# EAGLE design mbc_84_24_01_06 (EAGLE 7.6.0)

## Sheet 1 of 2
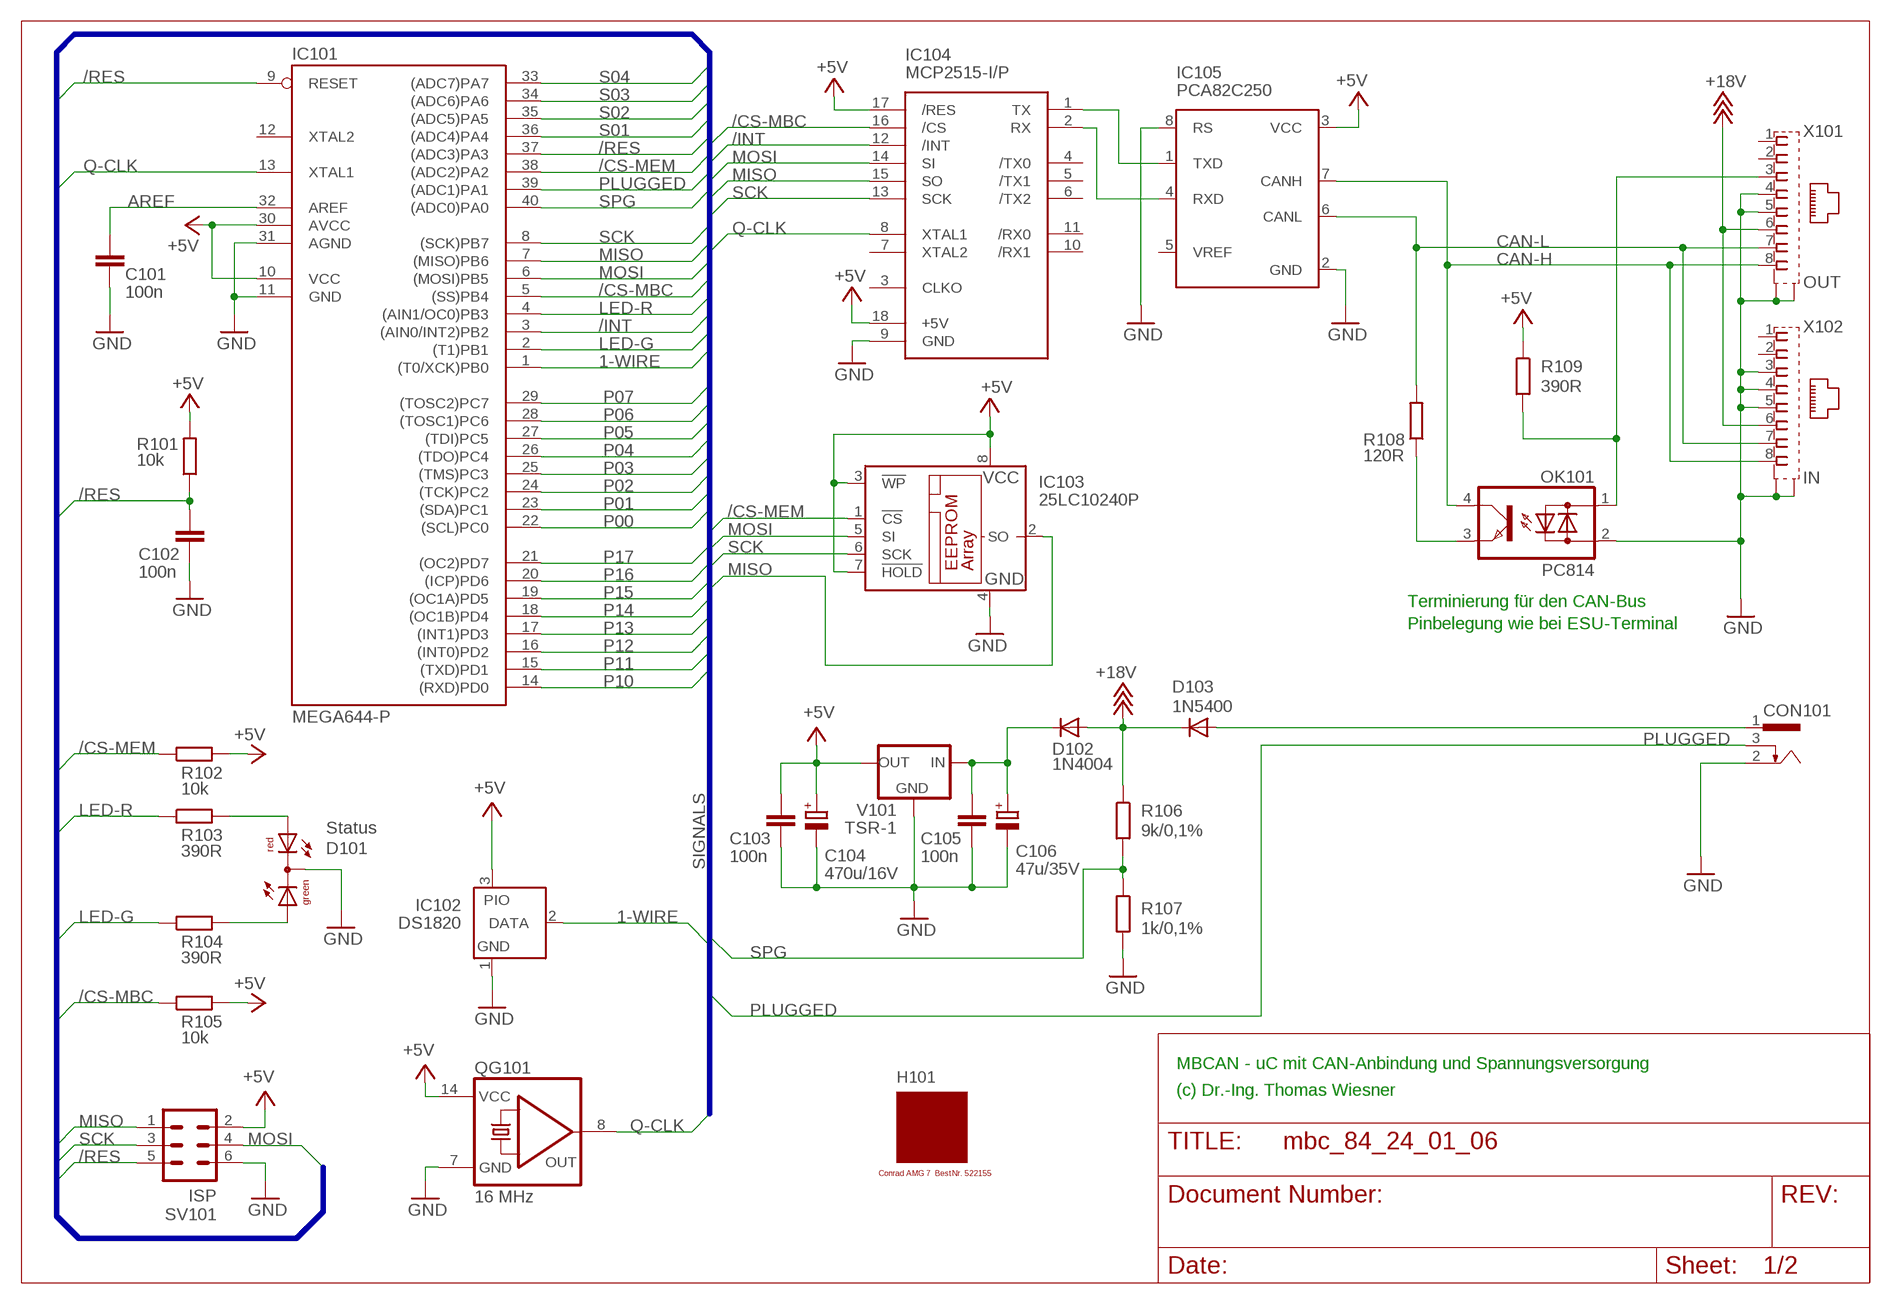
[diagram p0: schematic, sheet 1]

### Parts
C101  100n  C-EU025-025X050  [C025-025X050]
C102  100n  C-EU025-025X050  [C025-025X050]
C103  100n  C-EU025-025X050  [C025-025X050]
C104  470u/16V  CPOL-EUE3.5-8  [E3,5-8]
C105  100n  C-EU025-025X050  [C025-025X050]
C106  47u/35V  CPOL-EUE2.5-7  [E2,5-7]
CON101  POWER-JACK  [POWER-JACK]
D101  Status  DUOLED5MM  [DUOLED5MM]
D102  1N4004  [DO41-10]
D103  1N5400  [DO201-15]
H101  MODULGEHÄUSE-AMG-7  [MODULGEHÄUSE-1]
IC101  MEGA644-P  MEGA323-P  [DIL40]
IC102  DS1820  DS2405  [TO92-]
IC103  25LC10240P  25LC040P  [DIL8]
IC104  MCP2515-I/P  MCP2510-I/P  [DIL18]
IC105  PCA82C250  [DIL08]
OK101  PC814  [DIL04]
QG101  16 MHz  QG5860  [DIL14S]
R101  10k  R-EU_0207/10  [0207/10]
R102  10k  R-EU_0207/10  [0207/10]
R103  390R  R-EU_0207/10  [0207/10]
R104  390R  R-EU_0207/10  [0207/10]
R105  10k  R-EU_0207/10  [0207/10]
R106  9k/0,1%  R-EU_0207/10  [0207/10]
R107  1k/0,1%  R-EU_0207/10  [0207/10]
R108  120R  R-EU_0207/10  [0207/10]
R109  390R  R-EU_0207/10  [0207/10]
SV101  ISP  ML6  [ML6]
V101  TSR-1  [TRACO-TSR-1]
X101  OUT  0446200002  [0446200002]
X102  IN  0446200002  [0446200002]

### Nets
1-WIRE: IC101.1((T0/XCK)PB0) IC102.2(DATA)
+5V: C103.1 C104.+ IC101.10(VCC) IC101.30(AVCC) IC102.3(PIO) IC103.3(!WP) IC103.7(!HOLD) IC103.8(VCC) IC104.17(/RES) IC104.18(+5V) IC105.3(VCC) QG101.14(VCC) R101.2 R102.2 R105.2 R109.1 SV101.2 V101.OUT ; also sheet 2
+18V: D102.A D103.C R106.1 X101.6 X102.6 ; also sheet 2
/CS-MBC: IC101.5((SS)PB4) IC104.16(/CS) R105.1
/CS-MEM: IC101.38((ADC2)PA2) IC103.1(!CS) R102.1
/INT: IC101.3((AIN0/INT2)PB2) IC104.12(/INT)
/RES: C102.1 IC101.9(RESET) IC101.37((ADC3)PA3) R101.1 SV101.5
AREF: C101.1 IC101.32(AREF)
CAN-H: IC105.7(CANH) OK101.4(C) X101.8 X102.8
CAN-L: IC105.6(CANL) R108.2 X101.7 X102.7
GND: C101.2 C102.2 C103.2 C104.- C105.2 C106.- CON101.2 D101.K(C) IC101.11(GND) IC101.31(AGND) IC102.1(GND) IC103.4(GND) IC104.9(GND) IC105.2(GND) IC105.8(RS) OK101.2(AC2) QG101.7(GND) R107.2 SV101.6 V101.GND X101.4 X101.5 X101.S@1(S1) X101.S@2(S2) X102.3 X102.4 X102.5 X102.S@1(S1) X102.S@2(S2) ; also sheet 2
LED-G: IC101.2((T1)PB1) R104.1
LED-R: IC101.4((AIN1/OC0)PB3) R103.1
MISO: IC101.7((MISO)PB6) IC103.2(SO) IC104.15(SO) SV101.1
MOSI: IC101.6((MOSI)PB5) IC103.5(SI) IC104.14(SI) SV101.4
N$1: IC104.1(TX) IC105.1(TXD)
N$2: IC104.2(RX) IC105.4(RXD)
N$3: OK101.3(E) R108.1
N$5: OK101.1(AC1) R109.2 X101.3
N$6: C105.1 C106.+ D102.C V101.IN
N$9: D101.AR R103.2
N$13: D101.AG R104.2
P00: IC101.22((SCL)PC0) ; also sheet 2
P01: IC101.23((SDA)PC1) ; also sheet 2
P02: IC101.24((TCK)PC2) ; also sheet 2
P03: IC101.25((TMS)PC3) ; also sheet 2
P04: IC101.26((TDO)PC4) ; also sheet 2
P05: IC101.27((TDI)PC5) ; also sheet 2
P06: IC101.28((TOSC1)PC6) ; also sheet 2
P07: IC101.29((TOSC2)PC7) ; also sheet 2
P10: IC101.14((RXD)PD0) ; also sheet 2
P11: IC101.15((TXD)PD1) ; also sheet 2
P12: IC101.16((INT0)PD2) ; also sheet 2
P13: IC101.17((INT1)PD3) ; also sheet 2
P14: IC101.18((OC1B)PD4) ; also sheet 2
P15: IC101.19((OC1A)PD5) ; also sheet 2
P16: IC101.20((ICP)PD6) ; also sheet 2
P17: IC101.21((OC2)PD7) ; also sheet 2
PLUGGED: CON101.3 IC101.39((ADC1)PA1)
Q-CLK: IC101.13(XTAL1) IC104.8(XTAL1) QG101.8(OUT)
S01: IC101.36((ADC4)PA4) ; also sheet 2
S02: IC101.35((ADC5)PA5) ; also sheet 2
S03: IC101.34((ADC6)PA6) ; also sheet 2
S04: IC101.33((ADC7)PA7) ; also sheet 2
SCK: IC101.8((SCK)PB7) IC103.6(SCK) IC104.13(SCK) SV101.3
SPG: IC101.40((ADC0)PA0) R106.2 R107.1
V-NETZTEIL1: CON101.1 D103.A
Unconnected: IC101.12(XTAL2) IC104.3(CLKO) IC104.4(/TX0) IC104.5(/TX1) IC104.6(/TX2) IC104.7(XTAL2) IC104.10(/RX1) IC104.11(/RX0) IC105.5(VREF) X101.1 X101.2 X102.1 X102.2

### Buses
SIGNALS

### Notes on the sheet
- Terminierung für den CAN-Bus
- Pinbelegung wie bei ESU-Terminal
- MBCAN - uC mit CAN-Anbindung und Spannungsversorgung
- (c) Dr.-Ing. Thomas Wiesner

## Sheet 2 of 2
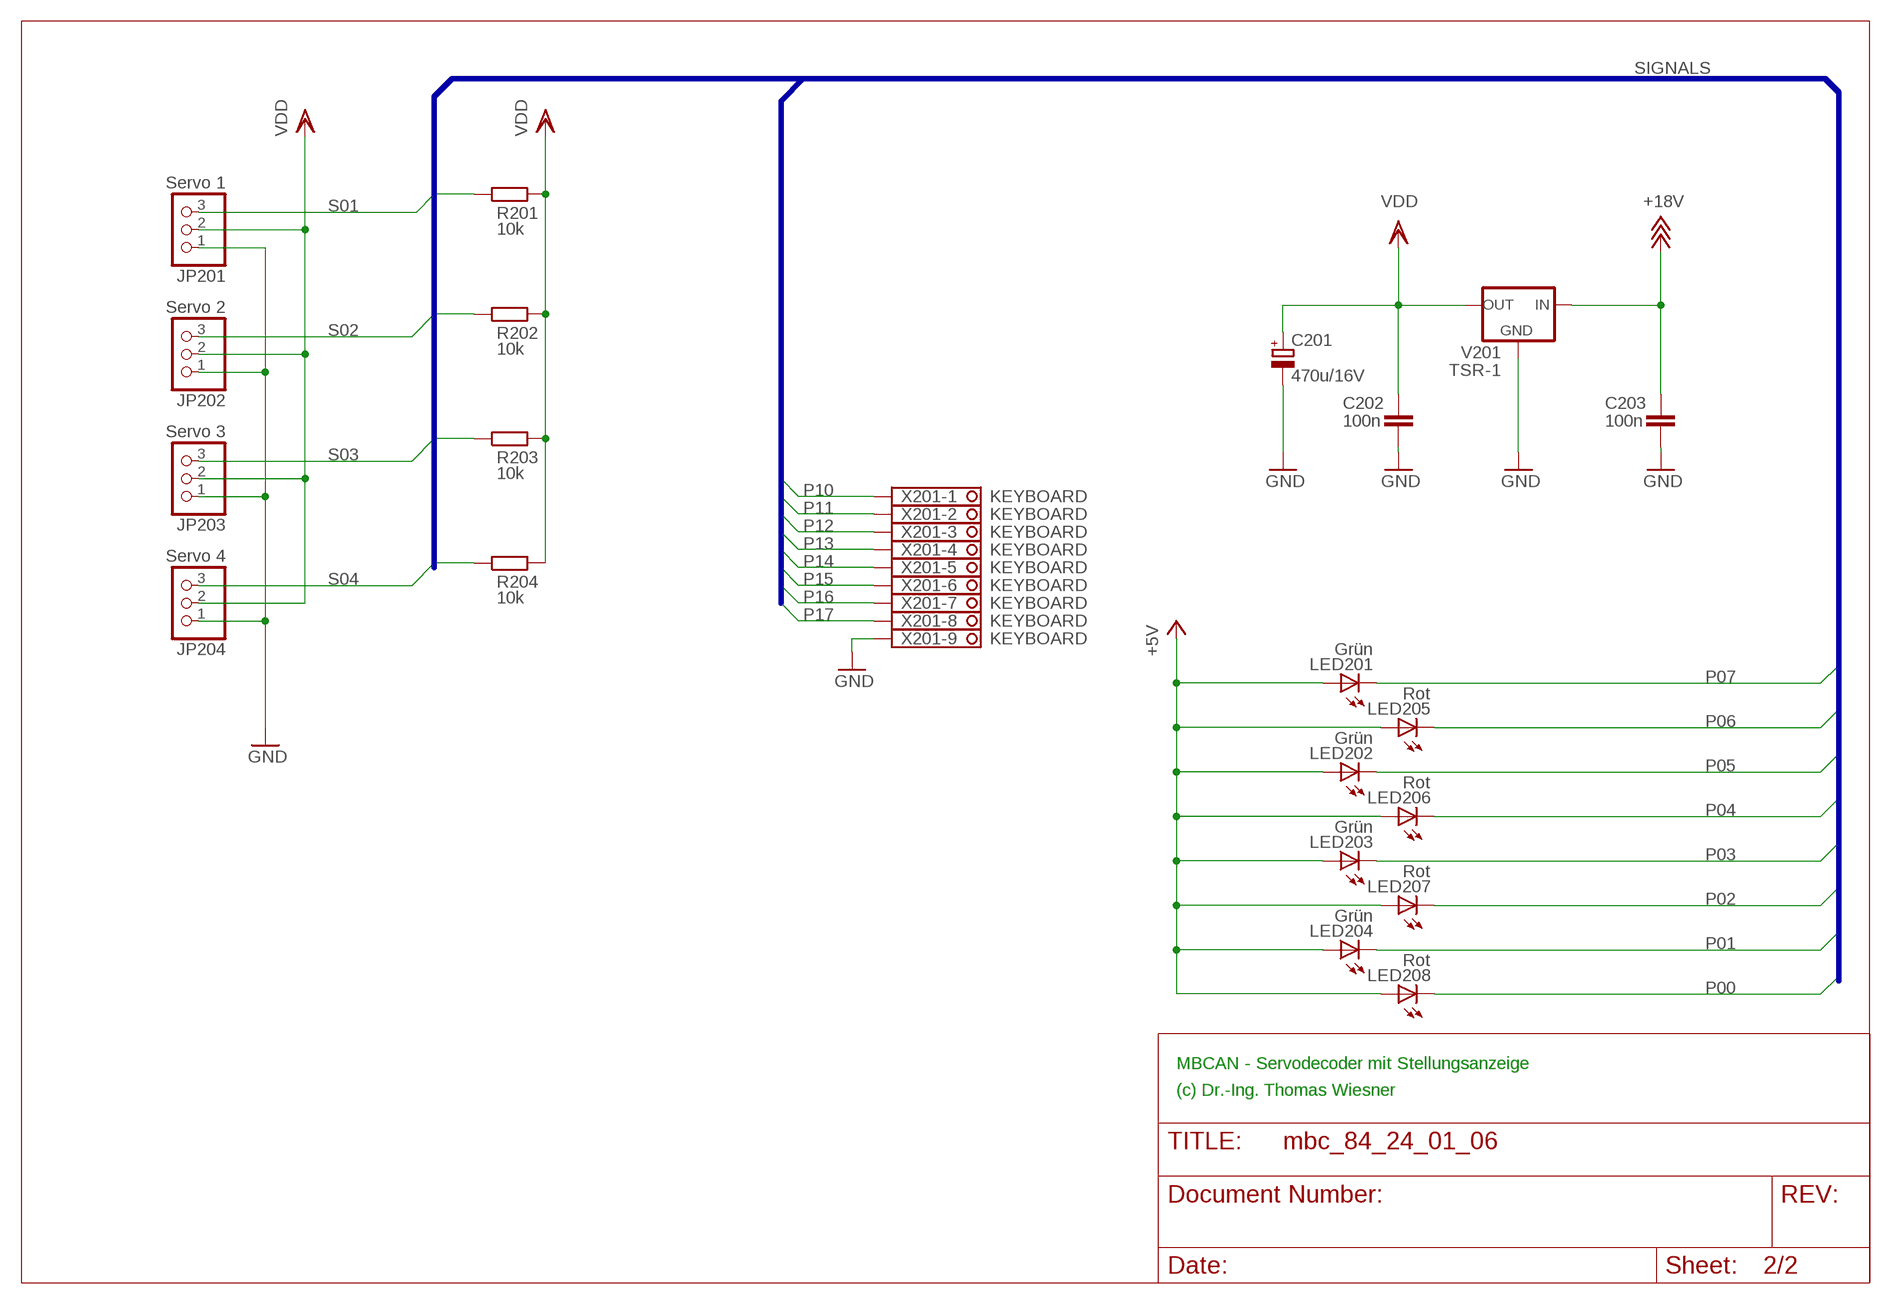
[diagram p1: schematic, sheet 2]

### Parts
C201  470u/16V  CPOL-EUE3.5-8  [E3,5-8]
C202  100n  C-EU025-025X050  [C025-025X050]
C203  100n  C-EU025-025X050  [C025-025X050]
JP201  Servo 1  PINHD-1X3  [1X03]
JP202  Servo 2  PINHD-1X3  [1X03]
JP203  Servo 3  PINHD-1X3  [1X03]
JP204  Servo 4  PINHD-1X3  [1X03]
LED201  Grün  LED3MM  [LED3MM]
LED202  Grün  LED3MM  [LED3MM]
LED203  Grün  LED3MM  [LED3MM]
LED204  Grün  LED3MM  [LED3MM]
LED205  Rot  LED3MM  [LED3MM]
LED206  Rot  LED3MM  [LED3MM]
LED207  Rot  LED3MM  [LED3MM]
LED208  Rot  LED3MM  [LED3MM]
R201  10k  R-EU_0207/10  [0207/10]
R202  10k  R-EU_0207/10  [0207/10]
R203  10k  R-EU_0207/10  [0207/10]
R204  10k  R-EU_0207/10  [0207/10]
V201  TSR-1  [TRACO-TSR-1]
X201  KEYBOARD  1751316  [1751316]

### Nets
+5V: LED201.A LED202.A LED203.A LED204.A LED205.A LED206.A LED207.A LED208.A ; also sheet 1
+18V: C203.1 V201.IN ; also sheet 1
GND: C201.- C202.2 C203.2 JP201.1 JP202.1 JP203.1 JP204.1 V201.GND X201.9 ; also sheet 1
P00: LED208.K(C) ; also sheet 1
P01: LED204.K(C) ; also sheet 1
P02: LED207.K(C) ; also sheet 1
P03: LED203.K(C) ; also sheet 1
P04: LED206.K(C) ; also sheet 1
P05: LED202.K(C) ; also sheet 1
P06: LED205.K(C) ; also sheet 1
P07: LED201.K(C) ; also sheet 1
P10: X201.1 ; also sheet 1
P11: X201.2 ; also sheet 1
P12: X201.3 ; also sheet 1
P13: X201.4 ; also sheet 1
P14: X201.5 ; also sheet 1
P15: X201.6 ; also sheet 1
P16: X201.7 ; also sheet 1
P17: X201.8 ; also sheet 1
S01: JP201.3 R201.1 ; also sheet 1
S02: JP202.3 R202.1 ; also sheet 1
S03: JP203.3 R203.1 ; also sheet 1
S04: JP204.3 R204.1 ; also sheet 1
VDD: C201.+ C202.1 JP201.2 JP202.2 JP203.2 JP204.2 R201.2 R202.2 R203.2 R204.2 V201.OUT

### Buses
SIGNALS

### Notes on the sheet
- MBCAN - Servodecoder mit Stellungsanzeige
- (c) Dr.-Ing. Thomas Wiesner

## Library data of the parts
C101-C103 C105 C202 C203 = rcl:C-EU: CAPACITOR, European symbol
C104 C106 C201 = rcl:CPOL-EU: POLARIZED CAPACITOR, European symbol
CON101 = mbc:POWER-JACK
D101 = led:DUOLED5MM: DUO LED 2 colors, 5 mm, round
D102 = diode:1N4004: DIODE general purpose rectifier, 1 A
D103 = diode:1N5400: DIODE standard rectifier, 3 A, 50 V (Motorola)
H101 = mbc:MODULGEHÄUSE-AMG-7: Gehäuse Conrad AMG 7 BestNr. 522155
IC101 = atmel:MEGA323-P: MICROCONTROLLER 32 Kbytes FLASH 2 Kbytes SRAM 1 Kbytes EEPROM USART 8-channel 10 bit ADC Source: avr.lbr; OC_FARNELL: unknown; OC_NEWARK: unknown
IC102 = maxim:DS2405: Addressable Switch DALLAS Semiconductor; MF: DALLAS SEMICONDUCTOR; MPN: DS2405; OC_FARNELL: 1188025; OC_NEWARK: 06F4645
IC103 = microchip:25*: Serial EEPROM 4K/ 8K , SPI bus; MF: MICROCHIP; MPN: 25LC040/P; OC_FARNELL: 9758100; OC_NEWARK: 96K4091
IC104 = mbc:MCP2510: BASIC-CAN 2.0a Controller Stand-alone CAN controller von Microchip
IC105 = micro-philips:PCA82C250: CAN CONTROLLER INTERFACE; OC_FARNELL: 3692358; OC_NEWARK: unknown
JP201-JP204 = pinhead:PINHD-1X3: PIN HEADER
LED201-LED208 = led:LED: LED OSRAM: - CHIPLED LG R971, LG N971, LY N971, LG Q971, LY Q971, LO R971, LY R971 LH N974, LH R974 LS Q976, LO Q976, LY Q976 LO Q996 - Hyper CHIPLED LW Q18S LB Q993, LB Q99A, LB R99A - SideLED LS A670, LO A670, LY A670, LG A670, LP A670 LB A673, LV A673, LT A673, LW A673 LH A674 LY A675 LS A676, LA A676, LO A676, LY A676, LW A676 LS A679, LY A679, LG A679 - Hyper Micro SIDELED® LS Y876, LA Y876, LO Y876, LY Y876 LT Y87S - SmartLED LW L88C, LW L88S LB L89C, LB L89S, LG L890 LS L89K, LO L89K, LY L89K LS L896, LA L896, LO L896, LY L896 - TOPLED LS T670, LO T670, LY T670, LG T670, LP T670 LSG T670, LSP T670, LSY T670, LOP T670, LYG T670 LG T671, LOG T671, LSG T671 LB T673, LV T673, LT T673, LW T673 LH T674 LS T676, LA T676, LO T676, LY T676, LB T676, LH T676, LSB T676, LW T676 LB T67C, LV T67C, LT T67C, LS T67K, LO T67K, LY T67K, LW E67C LS E67B, LA E67B, LO E67B, LY E67B, LB E67C, LV E67C, LT E67C LW T67C LS T679, LY T679, LG T679 LS T770, LO T770, LY T770, LG T770, LP T770 LB T773, LV T773, LT T773, LW T773 LH T774 LS E675, LA E675, LY E675, LS T675 LS T776, LA T776, LO T776, LY T776, LB T776 LHGB T686 LT T68C, LB T68C - Hyper Mini TOPLED® LB M676 - Mini TOPLED Santana® LG M470 LS M47K, LO M47K, LY M47K Source: http://www.osram.convergy.de LUXEON: - LUMILED® LXK2-PW12-R00, LXK2-PW12-S00, LXK2-PW14-U00, LXK2-PW14-V00 LXK2-PM12-R00, LXK2-PM12-S00, LXK2-PM14-U00 LXK2-PE12-Q00, LXK2-PE12-R00, LXK2-PE12-S00, LXK2-PE14-T00, LXK2-PE14-U00 LXK2-PB12-K00, LXK2-PB12-L00, LXK2-PB12-M00, LXK2-PB14-N00, LXK2-PB14-P00, LXK2-PB14-Q00 LXK2-PR12-L00, LXK2-PR12-M00, LXK2-PR14-Q00, LXK2-PR14-R00 LXK2-PD12-Q00, LXK2-PD12-R00, LXK2-PD12-S00 LXK2-PH12-R00, LXK2-PH12-S00 LXK2-PL12-P00, LXK2-PL12-Q00, LXK2-PL12-R00 Source: www.luxeon.com KINGBRIGHT: KA-3528ASYC Source: www.kingbright.com
OK101 = optocoupler:PC814: SHARP OPTO COUPLER; OC_FARNELL: 9707662; OC_NEWARK: unknown
QG101 = crystal:QG5860: CRYSTAL RESONATOR; OC_FARNELL: unknown; OC_NEWARK: unknown
R101-R109 R201-R204 = resistor:R-EU_: RESISTOR, European symbol
SV101 = con-ml:ML6: HARTING; OC_FARNELL: unknown; OC_NEWARK: unknown
V101 V201 = mbc:TSR-1: Spannungsregler Hersteller: TRACO Typ: TSR-1 5V: TSR 1-2450 Spg: 5V Strom: 1A Reichelt TSR 1-2450
X101 X102 = mbc:0446200002: RJ-45 INVERTED MODULAR JACK ASSEMBLY WITH RJ-11 KEEPOUT FEATURE Source: Data sheet <http://www.farnell.com/datasheets/73207.pdf> MOLEX 0446200002 BUCHSE, RJ45, GESCHIRMT Source: Farnell <http://de.farnell.com/molex/0446200002/buchse-rj45-geschirmt/dp/9251910?ost=9251910>; MF: MOLEX; MPN: 0446200002; OC_FARNELL: 9251910
X201 = con-phoenix-350:1751316: MKDS 1/ 9-3,5 Printklemme Nennstrom: 10 A Bemessungsspannung: 160 V Raster: 3,5 mm Polzahl: 9 Montageart: Löten Anschlussart: Schraubanschluss Anschlussrichtung vom Leiter zur Platine: 0° Source: http://eshop.phoenixcontact.com .. 1751316.pdf; OC_FARNELL: unknown; OC_NEWARK: unknown

## Board
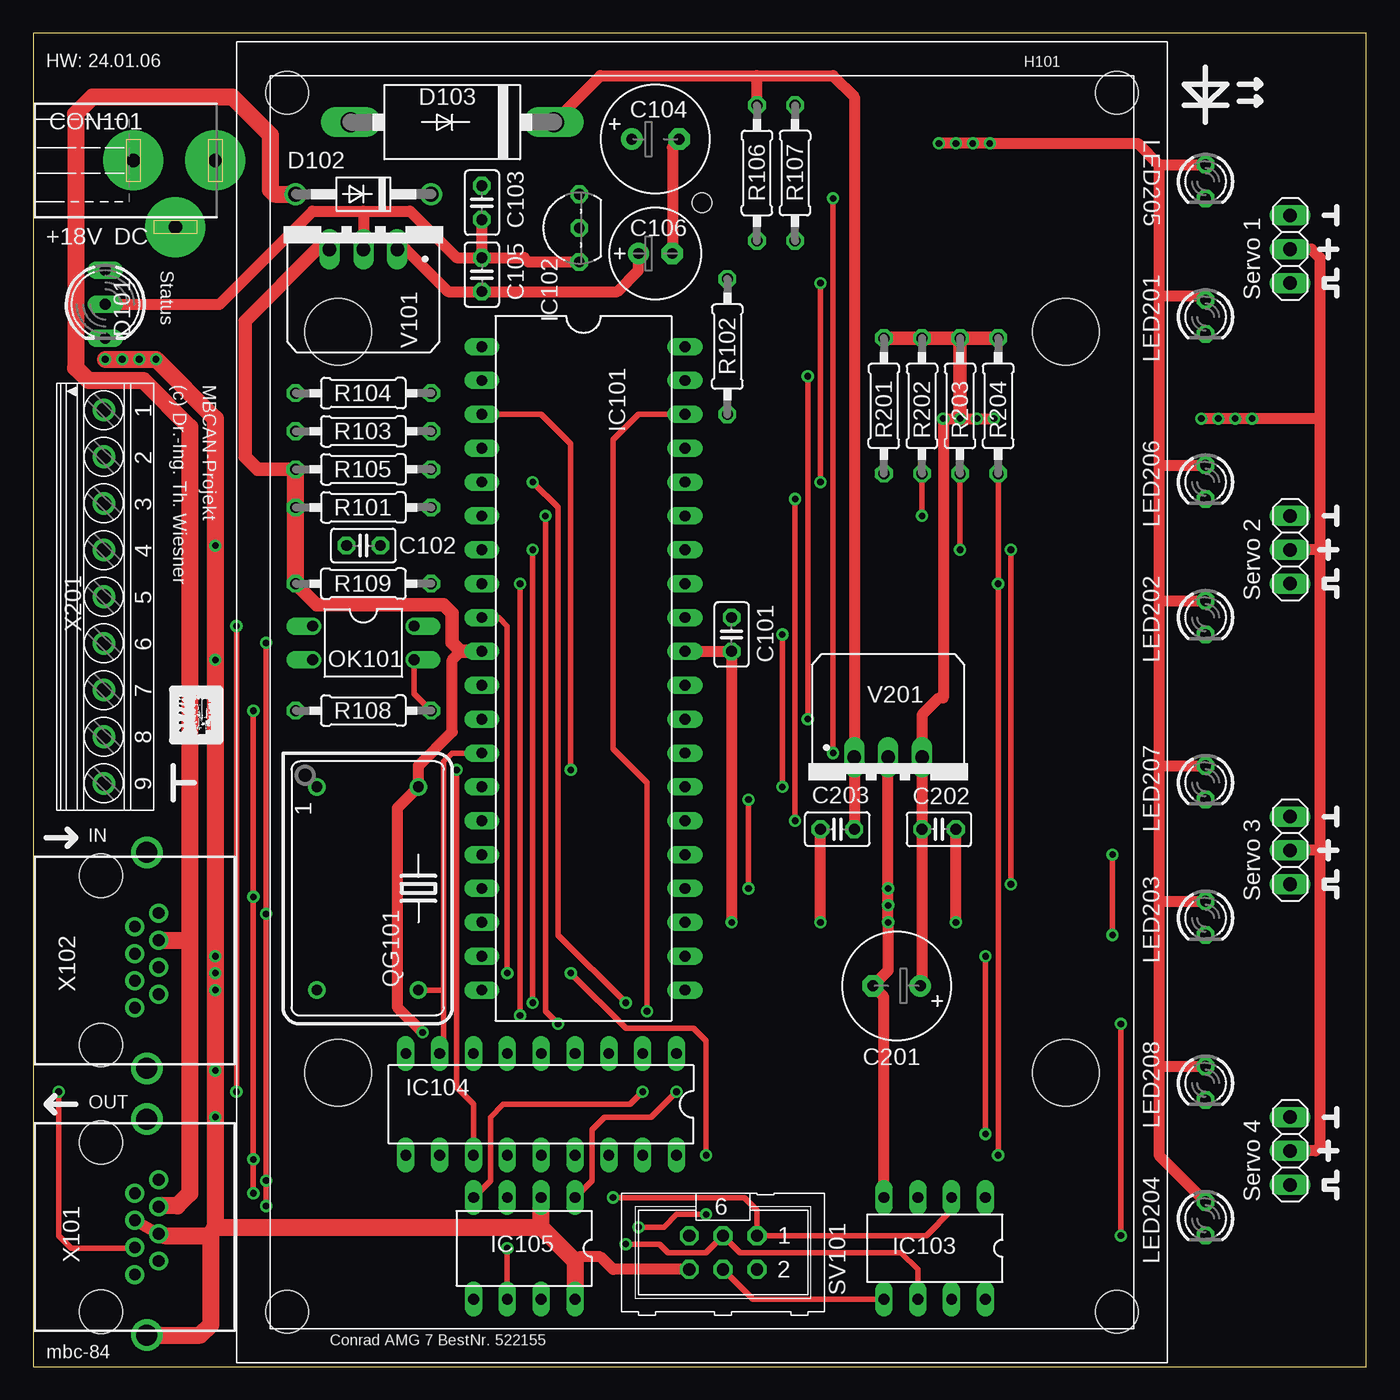
[diagram p2: board, top side]
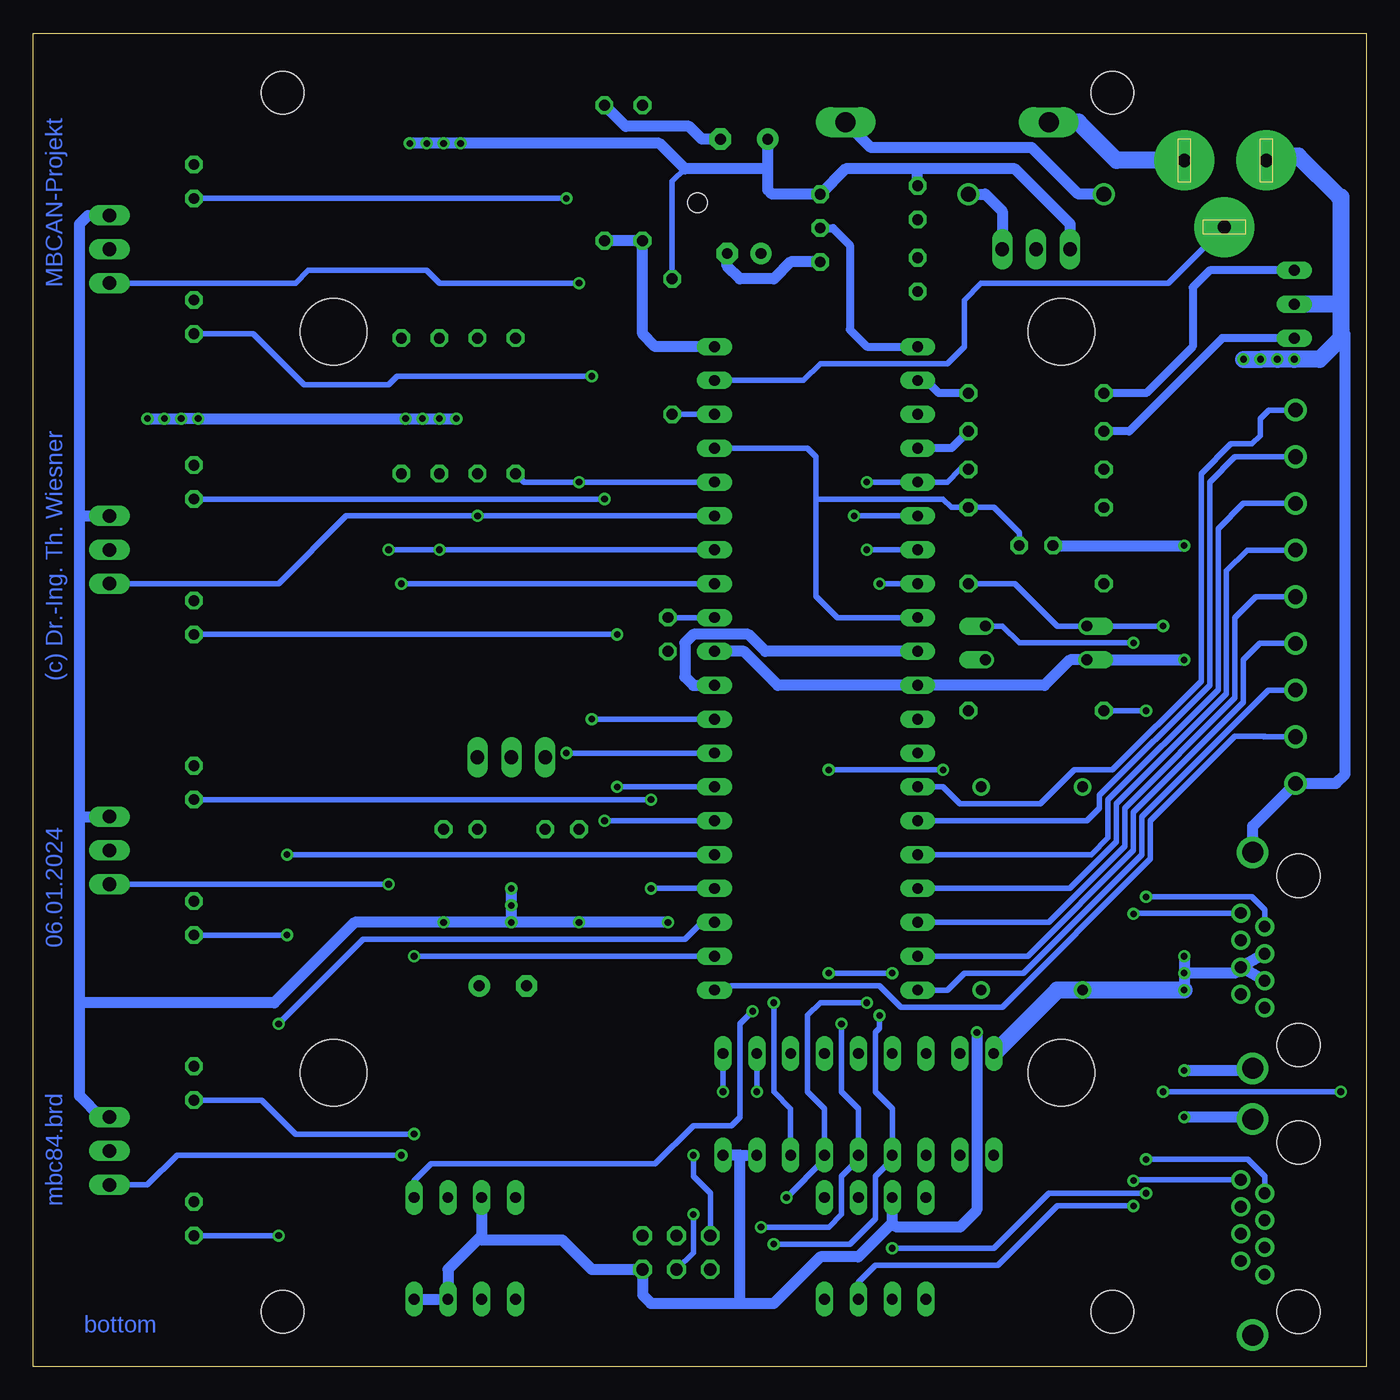
[diagram p3: board, bottom side, seen from below]

Size 100 x 99.99 mm. Coordinates in mm from the lower left corner, seen from the top.
Outline: 0,99.99 0,0 100,0 100,99.99 0,99.99
Copper layers (1*16): Top 0.035mm / dielectric 1.5mm / Bottom 0.035mm
Design rules "default *": minimum track width 10mil, minimum drill 0.5mm, track to track 8mil, track to pad 8mil, pad to pad 8mil, via to via 8mil, smd to smd 8mil, copper to edge 40mil, drill to drill 8mil, minimum pad ring 10mil, minimum via ring 8mil, stop-mask expansion 4mil, vias tented up to drill 0mil, thermal gap 10mil

### Footprints (pad centres in the part's own frame; a part is rotated, then mirrored left to right if it is on the bottom)
C025-025X050 = drill 0.813 octagon: 1 -1.27,0; 2 1.27,0
E3,5-8 = drill 0.813 pad 1.6: + -1.778,0 | drill 0.813 pad 1.6 octagon: - 1.778,0
E2,5-7 = drill 0.813 pad 1.6: + -1.27,0 | drill 0.813 pad 1.6 octagon: - 1.27,0
POWER-JACK = drill 1 pad 4.5: 1 0,6.03; 2 0,-0.12; 3 5,3.03
DUOLED5MM = drill 0.813 long: AG -2.54,0; AR 2.54,0; K 0,0
DO41-10 = drill 1.118: A 5.08,0; C -5.08,0
DO201-15 = drill 1.499 long: A 7.62,0; C -7.62,0
MODULGEHÄUSE-1 = hole 3.2: -45.72,-31.115; -45.72,31.115; 45.72,31.115; 45.72,-31.115 | hole 5: -27.781,-27.305; 27.781,-27.305; -27.781,27.305; 27.781,27.305 | hole 1.5: -37.465,0
DIL40 = drill 0.813 long: 1 -24.13,-7.62; 2 -21.59,-7.62; 3 -19.05,-7.62; 4 -16.51,-7.62; 5 -13.97,-7.62; 6 -11.43,-7.62; 7 -8.89,-7.62; 8 -6.35,-7.62; 9 -3.81,-7.62; 10 -1.27,-7.62; 11 1.27,-7.62; 12 3.81,-7.62; 13 6.35,-7.62; 14 8.89,-7.62; 15 11.43,-7.62; 16 13.97,-7.62; 17 16.51,-7.62; 18 19.05,-7.62; 19 21.59,-7.62; 20 24.13,-7.62; 21 24.13,7.62; 22 21.59,7.62; 23 19.05,7.62; 24 16.51,7.62; 25 13.97,7.62; 26 11.43,7.62; 27 8.89,7.62; 28 6.35,7.62; 29 3.81,7.62; 30 1.27,7.62; 31 -1.27,7.62; 32 -3.81,7.62; 33 -6.35,7.62; 34 -8.89,7.62; 35 -11.43,7.62; 36 -13.97,7.62; 37 -16.51,7.62; 38 -19.05,7.62; 39 -21.59,7.62; 40 -24.13,7.62
TO92- = drill 0.813 octagon: 1 -2.54,0; 2 0,0; 3 2.54,0
DIL8 = drill 0.813 long: 1 -3.81,-3.81; 2 -1.27,-3.81; 3 1.27,-3.81; 4 3.81,-3.81; 5 3.81,3.81; 6 1.27,3.81; 7 -1.27,3.81; 8 -3.81,3.81
DIL18 = drill 0.813 long: 1 -10.16,-3.81; 2 -7.62,-3.81; 3 -5.08,-3.81; 4 -2.54,-3.81 | drill 0.8 long: 5 0,-3.81; 6 2.54,-3.81; 7 5.08,-3.81; 8 7.62,-3.81; 9 10.16,-3.81; 10 10.16,3.81; 11 7.62,3.81; 12 5.08,3.81; 13 2.54,3.81; 14 0,3.81; 15 -2.54,3.81; 16 -5.08,3.81; 17 -7.62,3.81; 18 -10.16,3.81
DIL08 = drill 0.813 long: 1 -3.81,-3.81; 2 -1.27,-3.81; 3 1.27,-3.81; 4 3.81,-3.81; 5 3.81,3.81; 6 1.27,3.81; 7 -1.27,3.81; 8 -3.81,3.81
1X03 = drill 1.016 long: 1 -2.54,0; 2 0,0; 3 2.54,0
LED3MM = drill 0.813 octagon: A -1.27,0; K 1.27,0
DIL04 = drill 0.813 offset: 1 -1.27,-3.81; 2 1.27,-3.81; 3 1.27,3.81; 4 -1.27,3.81
DIL14S = drill 0.813: 1 -7.62,-3.81; 7 7.62,-3.81; 8 7.62,3.81; 14 -7.62,3.81
0207/10 = drill 0.813 octagon: 1 -5.08,0; 2 5.08,0
ML6 = drill 0.914 octagon: 1 -2.54,-1.27; 2 -2.54,1.27; 3 0,-1.27; 4 0,1.27; 5 2.54,-1.27; 6 2.54,1.27
TRACO-TSR-1 = drill 1.016 long: GND 0,2.54; IN -2.54,2.54; OUT 2.54,2.54
0446200002 = drill 0.889 pad 1.422: 1 3.556,2.54; 2 2.54,4.318; 3 1.524,2.54; 4 0.508,4.318; 5 -0.508,2.54; 6 -1.524,4.318; 7 -2.54,2.54; 8 -3.556,4.318 | drill 1.575 pad 2.286: S@1 -8.103,3.429; S@2 8.103,3.429 | hole 3.251: 6.35,0; -6.35,0
1751316 = drill 1.1 pad 1.7: 1 -13.973,-0.1; 2 -10.473,-0.1; 3 -6.973,-0.1; 4 -3.473,-0.1; 5 0.028,-0.1; 6 3.527,-0.1; 7 7.027,-0.1; 8 10.527,-0.1; 9 14.027,-0.1

### Placement (x,y rotation side)
C101  52.39,54.91 270 top
C102  24.77,61.57 180 top
C103  33.66,87.29 270 top
C104  46.67,92.06 0 top
C105  33.66,81.9 90 top
C106  46.67,83.48 0 top
C201  64.77,28.55 180 top
C202  67.94,40.3 0 top
C203  60.33,40.3 180 top
CON101  7.62,90.47 270 top
D101  5.4,79.67 270 top
D102  24.77,87.93 180 top
D103  31.43,93.33 180 top
H101  50.16,49.83 270 top
IC101  41.27,52.37 270 top
IC102  40.96,85.39 90 top
IC103  67.63,8.87 180 top
IC104  38.1,19.66 180 top
IC105  36.83,8.87 180 top
JP201  94.3,83.8 270 top
JP202  94.3,61.26 270 top
JP203  94.3,38.71 270 top
JP204  94.3,16.17 270 top
LED201  87.95,78.72 270 top
LED202  87.95,56.18 270 top
LED203  87.95,33.63 270 top
LED204  87.95,11.09 270 top
LED205  87.95,88.88 270 top
LED206  87.95,66.34 270 top
LED207  87.95,43.79 270 top
LED208  87.95,21.25 270 top
OK101  24.77,54.27 270 top
QG101  25.08,35.86 270 top
R101  24.77,64.43 180 top
R102  52.07,76.5 90 top
R103  24.77,70.15 180 top
R104  24.77,73.01 180 top
R105  24.77,67.29 180 top
R106  54.29,89.52 270 top
R107  57.15,89.52 90 top
R108  24.77,49.19 180 top
R109  24.77,58.72 0 top
R201  63.82,72.05 90 top
R202  66.67,72.05 90 top
R203  69.53,72.05 90 top
R204  72.39,72.05 90 top
SV101  51.75,8.55 180 top
V101  24.77,86.34 180 top
V201  64.14,43.16 0 top
X101  5.08,10.46 270 top
X102  5.08,30.46 270 top
X201  5.4,57.76 270 top

### Tracks (layer width: path | path; a pad name or v marks a point on that pad's centre or on a via)
1-WIRE
  Bottom 0.61: IC102.2 40.01,85.39 38.73,84.12 38.73,77.77 37.47,76.5 IC101.1
+5V  (via drill 0.5)
  Top 0.813: v29.21,25.06 27.3,26.97 27.3,41.89 QG101.14 28.89,45.06 31.43,47.6 31.43,53 32.07,53.64 | LED204.A 84.45,15.86 84.45,22.52 | 84.45,22.52 LED208.A | 84.45,57.45 84.45,45.06 | 84.45,45.06 84.45,34.9 | 84.45,34.9 84.45,22.52 | 84.45,34.9 LED203.A | 84.45,45.06 LED207.A | 84.45,57.45 LED202.A | 84.45,90.15 84.45,80.31 | 84.45,80.31 84.45,67.61 | 84.45,67.61 84.45,57.45 | 84.45,90.15 LED205.A | 84.45,67.61 LED206.A | LED201.A 87.63,80.31 84.45,80.31 | 84.45,90.15 82.87,91.74 v71.75,91.74 v70.48,91.74 v69.22,91.74 v67.94,91.74
  Top 1.016: IC101.10 32.07,53.64 31.43,54.27 31.43,56.49 30.8,57.13 21.27,57.13 R109.1 | V101.OUT 21.27,83.8 15.88,78.4 15.88,68.24 16.83,67.29 R105.2
  Top 1.27: R109.1 R101.2 R105.2
  Bottom 0.406: C104.+ 44.9,89.83 | R102.2 52.07,88.88 51.12,89.83
  Bottom 0.813: 46.99,15.86 IC104.18 | 46.99,15.86 IC104.17 | 46.99,4.74 46.99,15.86 | IC101.10 45.09,53.64 46.35,54.91 50.48,54.91 51.12,54.27 51.12,51.73 50.48,51.1 IC101.30 | 33.66,89.83 26.35,89.83 22.23,85.7 V101.OUT | 33.66,89.83 39.05,89.83 IC102.3 44.58,87.93 44.9,88.25 C104.+ | 44.9,89.83 51.12,89.83 53.02,91.74 v67.94,91.74 v69.22,91.74 v70.48,91.74 v71.75,91.74 | 35.56,10.78 38.1,8.24 40.96,8.24 44.45,4.74 46.99,4.74 | 35.56,10.78 IC105.3 | v29.21,25.06 29.21,11.73 30.48,10.46 35.24,10.46 35.56,10.78 | 46.99,4.74 53.66,4.74 54.29,5.38 SV101.2 58.1,7.28 60.33,9.51 66.36,9.51 IC103.3 66.36,9.82 68.9,7.28 IC103.7 IC103.8 | C103.1 33.66,89.83
+18V
  Top 0.813: D103.C 42.55,96.82 54.29,96.82 | 54.29,96.82 60.01,96.82 61.59,95.23 V201.IN C203.1 | R106.1 54.29,96.82
  Top 1.27: 11.75,32.05 11.75,70.47 8.26,73.96 4.13,73.96 3.17,74.91 3.17,93.96 4.45,95.23 14.92,95.23 17.78,92.37 17.78,88.25 18.1,87.93 D102.A | 11.75,32.05 11.75,13 10.79,12.04 9.46,12.04 X101.6 | X102.6 11.68,31.98 11.75,32.05
  Bottom 0.813: D102.A 21.59,87.93 25.08,91.42 37.15,91.42 D103.C
/CS-MBC  (via drill 0.5)
  Top 0.406: v37.47,66.34 39.37,64.43 39.37,32.36 v44.45,27.29
  Bottom 0.406: v37.47,66.34 IC101.5 31.43,66.34 30.48,67.29 R105.1 | v44.45,27.29 44.45,20.62 43.18,19.35 IC104.16
/CS-MEM  (via drill 0.5)
  Top 0.406: v46.04,26.65 46.04,43.79 43.5,46.33 43.5,69.51 45.4,71.42 IC101.38
  Bottom 0.406: R102.1 IC101.38 | IC103.1 71.44,13.95 70.17,15.22 53.34,15.22 50.48,18.08 47.62,18.08 46.99,18.71 46.99,25.7 v46.04,26.65
/INT  (via drill 0.5)
  Top 0.406: IC104.12 33.02,19.66 31.75,20.93 v31.75,44.75 | v40.32,44.75 40.32,69.2 38.1,71.42 IC101.3
  Bottom 0.406: v31.75,44.75 v40.32,44.75
/RES  (via drill 0.5)
  Top 0.406: v35.56,29.51 35.56,55.54 34.92,56.18 IC101.9 | v40.32,29.51 44.45,25.38 49.53,25.38 50.48,24.43 v50.48,15.86
  Bottom 0.406: IC101.37 41.91,68.88 41.27,68.24 41.27,65.07 | 41.27,65.07 41.27,57.76 39.69,56.18 IC101.9 | v35.56,29.51 v40.32,29.51 | v50.48,15.86 50.48,14.27 49.21,13 SV101.5 | 41.27,65.07 31.75,65.07 31.11,64.43 R101.1 27.94,64.43 26.04,62.53 C102.1
AREF
  Bottom 0.406: IC101.32 C101.1
CAN-H  (via drill 0.5)
  Top 0.406: v17.46,54.27 v17.46,33.95 v17.46,13.95 v17.46,12.04
  Bottom 0.406: X101.8 17.4,14.01 v17.46,13.95 | v17.46,54.27 26.04,54.27 27.3,55.54 OK101.4 | v17.46,12.04 23.18,12.04 27.62,7.6 36.83,7.6 38.1,6.33 IC105.7 | X102.8 17.4,34.02 v17.46,33.95
CAN-L  (via drill 0.5)
  Top 0.406: v16.51,49.19 v16.51,35.22 v16.51,15.54 v16.51,13 | v35.56,8.87 IC105.6
  Bottom 0.406: R108.2 v16.51,49.19 | v16.51,13 23.81,13 27.94,8.87 v35.56,8.87 | X101.7 7.62,14.27 8.89,15.54 v16.51,15.54 | X102.7 7.62,34.27 8.57,35.22 v16.51,35.22
GND  (via drill 0.5)
  Top 0.406: C104.- 48.45,91.93
  Top 0.813: 24.77,86.66 V101.GND | 24.77,86.66 28.26,86.66 31.75,83.17 C105.2 | C105.2 36.83,83.17 37.15,82.85 IC102.1 | D101.K 13.97,79.67 20.95,86.66 24.77,86.66 | 48.45,91.93 47.94,91.42 C106.- | IC101.31 C101.2 v52.39,33.32 | v59.05,33.32 C203.2 | v69.22,33.32 C202.2 | V201.GND v64.14,35.86 v64.14,34.59 v64.14,33.32 64.14,29.7 C201.- 63.82,27.73 IC103.4 | SV101.6 43.5,7.28 42.55,8.24 40.96,8.24 40.64,7.92 | X101.5 X101.4 | C105.2 C103.2
  Top 1.27: 13.65,10.46 v13.65,18.71 v13.65,22.21 v13.65,28.24 v13.65,29.51 v13.65,30.78 v13.65,53 v13.65,61.57 13.65,71.1 v9.21,75.55 v5.4,75.55 | 13.65,10.46 13.18,9.66 13.34,9.82 | IC105.8 40.64,7.92 38.1,10.46 | 38.1,10.46 IC105.2 | 13.65,10.46 38.1,10.46 | X101.S@2 12.54,2.35 13.34,3.15 13.34,9.82 | X101.4 9.84,9.82 13.34,9.82
  Bottom 0.61: 1.59,77.45 1.91,77.77
  Bottom 0.813: IC101.31 46.67,53.64 44.13,51.1 IC101.11 24.13,51.1 22.23,53 OK101.2 v13.65,53 | v52.39,33.32 v59.05,33.32 v64.14,33.32 | 96.52,27.29 81.92,27.29 75.88,33.32 v69.22,33.32 v64.14,33.32 | JP204.1 94.93,18.71 96.52,20.3 96.52,27.29 | 96.52,27.29 96.52,41.25 | 96.52,41.25 JP203.1 | 96.52,41.25 96.52,63.8 | 96.52,63.8 JP202.1 | 96.52,63.8 96.52,85.7 95.89,86.34 JP201.1 | v64.14,33.32 v64.14,34.59 v64.14,35.86 | 1.59,77.45 1.59,44.43 2.28,43.74 X201.9 8.51,40.53 X102.S@1 | C102.2 v13.65,61.57 | X101.S@1 8.66,18.71 v13.65,18.71 | X102.S@2 8.66,22.21 v13.65,22.21 | X102.5 X102.4 | X102.3 X102.4 | X102.4 9.84,29.51 v13.65,29.51 | v13.65,30.78 v13.65,28.24 | C104.- 49.85,92.06 50.8,93.01 55.56,93.01 R107.2 | IC102.1 43.18,82.85 44.45,81.58 46.99,81.58 47.94,82.53 C106.-
  Bottom 1.27: 1.91,79.67 1.91,87.73 2.02,87.73 5.08,90.79 7.18,90.79 CON101.2 | 1.91,79.67 D101.K | 1.91,79.67 1.91,77.77 1.91,77.13 3.49,75.55 v5.4,75.55 v6.67,75.55 v7.94,75.55 v9.21,75.55 | v13.65,28.24 QG101.7 23.18,28.24 IC104.9
LED-G
  Bottom 0.61: R104.1 32.07,73.01 33.02,73.96 IC101.2
LED-R
  Bottom 0.61: IC101.4 31.11,68.88 R103.1
MISO  (via drill 0.5)
  Top 0.406: v37.47,61.26 v37.47,27.29 | IC103.2 68.9,11.73 66.99,9.82 SV101.1 54.29,11.73 53.34,12.68 v43.5,12.68
  Bottom 0.406: IC101.7 v37.47,61.26 | v37.47,27.29 40.96,27.29 41.91,26.33 41.91,20.62 40.64,19.35 IC104.15 40.64,15.54 v43.5,12.68
MOSI  (via drill 0.5)
  Top 0.406: v38.42,63.8 38.42,26.65 v39.37,25.7 | IC103.5 53.98,5.06 SV101.4 | v45.4,10.46 47.31,10.46 48.26,11.41 v50.48,11.41
  Bottom 0.406: IC101.6 v38.42,63.8 | v39.37,25.7 39.37,20.62 38.1,19.35 IC104.14 38.1,15.54 39.37,14.27 39.37,11.41 40.32,10.46 v45.4,10.46 | v50.48,11.41 50.48,8.55 SV101.4
N$1  (via drill 0.5)
  Top 0.406: v48.26,20.62 46.35,18.71 42.86,18.71 41.91,17.76 41.91,13.95 IC105.1
  Bottom 0.406: v48.26,20.62 IC104.1
N$2  (via drill 0.5)
  Top 0.406: v45.72,20.62 44.77,19.66 35.24,19.66 34.29,18.71 34.29,13.95 IC105.4
  Bottom 0.406: v45.72,20.62 IC104.2
N$3
  Top 0.406: OK101.3 28.57,50.46 R108.1
N$5  (via drill 0.5)
  Top 0.406: v15.24,55.54 v15.24,20.62 | v1.91,20.62 1.91,9.82 2.86,8.87 7.56,8.87 X101.3
  Bottom 0.406: R109.2 26.35,58.72 23.18,55.54 OK101.1 v15.24,55.54 | v15.24,20.62 v1.91,20.62
N$6
  Top 0.813: V101.IN 27.94,83.8 31.11,80.62 C105.1 43.81,80.62 45.4,82.21 C106.+
  Bottom 0.813: V101.IN 27.3,86.66 28.57,87.93 D102.C
N$9
  Bottom 0.61: R103.2 17.78,70.15 10.79,77.13 D101.AR
N$13
  Bottom 0.61: R104.2 16.51,73.01 13.02,76.5 13.02,80.94 11.75,82.21 D101.AG
P00  (via drill 0.5)
  Top 0.406: v71.44,17.44 v71.44,30.78
  Bottom 0.406: LED208.K 82.87,19.98 80.33,17.44 v71.44,17.44 | v71.44,30.78 IC101.22
P01  (via drill 0.5)
  Top 0.406: v81.6,25.7 v81.6,9.82
  Bottom 0.406: IC101.23 49.85,33.32 51.12,32.05 75.25,32.05 v81.6,25.7 | v81.6,9.82 LED204.K
P02  (via drill 0.5)
  Top 0.406: v53.66,42.52 v53.66,35.86
  Bottom 0.406: LED207.K v53.66,42.52 | v53.66,35.86 IC101.24
P03  (via drill 0.5)
  Top 0.406: v80.96,38.4 v80.96,32.36
  Bottom 0.406: IC101.25 v80.96,38.4 | v80.96,32.36 LED203.K
P04  (via drill 0.5)
  Top 0.406: v57.15,65.07 v57.15,40.94
  Bottom 0.406: LED206.K v57.15,65.07 | v57.15,40.94 IC101.26
P05  (via drill 0.5)
  Top 0.406: v56.2,54.91 v56.2,43.48
  Bottom 0.406: LED202.K v56.2,54.91 | v56.2,43.48 IC101.27
P06  (via drill 0.5)
  Top 0.406: v60.01,87.61 v60.01,46.02
  Bottom 0.406: LED205.K v60.01,87.61 | v60.01,46.02 IC101.28
P07  (via drill 0.5)
  Top 0.406: v58.1,74.28 v58.1,48.56
  Bottom 0.406: LED201.K 83.5,77.45 79.69,73.64 73.34,73.64 72.71,74.28 v58.1,74.28 | v58.1,48.56 IC101.29
P10
  Bottom 0.406: X201.1 7.3,71.74 7.94,71.1 7.94,69.83 8.57,69.2 10.16,69.2 12.38,66.97 12.38,51.41 19.05,44.75 21.91,44.75 24.45,42.21 30.48,42.21 31.75,43.48 IC101.14
P11
  Bottom 0.406: X201.2 9.85,68.24 11.75,66.34 11.75,51.1 20,42.84 20,41.89 20.95,40.94 IC101.15
P12
  Bottom 0.406: X201.3 9.22,64.74 11.11,62.84 11.11,50.78 19.37,42.52 19.37,39.67 20.64,38.4 IC101.16
P13
  Bottom 0.406: X201.4 8.91,61.24 10.48,59.67 10.48,50.46 18.73,42.21 18.73,39.35 22.23,35.86 IC101.17
P14
  Bottom 0.406: X201.5 8.28,57.74 9.84,56.18 9.84,50.14 18.1,41.89 18.1,39.03 23.81,33.32 IC101.18
P15
  Bottom 0.406: X201.6 7.97,54.24 9.21,53 9.21,49.83 17.46,41.57 17.46,38.71 25.4,30.78 IC101.19
P16
  Bottom 0.406: X201.7 7.34,50.74 16.83,41.25 16.83,38.4 25.72,29.51 30.16,29.51 31.43,28.24 IC101.20
P17
  Bottom 0.406: X201.8 7.67,47.24 7.62,47.29 9.84,47.29 16.19,40.94 16.19,38.08 27.3,26.97 34.92,26.97 36.51,28.55 47.62,28.55 47.94,28.24 IC101.21
PLUGGED
  Bottom 0.406: IC101.39 42.23,73.96 40.96,75.23 31.43,75.23 30.16,76.5 30.16,79.99 28.89,81.26 14.86,81.26 CON101.3
Q-CLK
  Top 0.406: IC101.13 31.43,46.02 30.8,45.38 30.8,28.24 | 30.8,28.24 30.8,23.79 IC104.8 | 30.8,28.24 QG101.8
S01  (via drill 0.5)
  Top 0.406: v59.05,81.26 v59.05,66.34
  Bottom 0.406: JP201.3 80.33,81.26 79.38,82.21 70.48,82.21 69.53,81.26 v59.05,81.26 | IC101.36 v59.05,66.34 63.18,66.34 R201.1
S02  (via drill 0.5)
  Top 0.406: R202.1 v66.67,63.8
  Bottom 0.406: JP202.3 81.6,58.72 76.52,63.8 v66.67,63.8 IC101.35
S03  (via drill 0.5)
  Top 0.406: v73.34,36.17 v73.34,61.26 | R203.1 v69.53,61.26
  Bottom 0.406: JP203.3 v73.34,36.17 | v73.34,61.26 v69.53,61.26 IC101.34
S04  (via drill 0.5)
  Top 0.406: v72.39,15.86 v72.39,58.72 R204.1
  Bottom 0.406: IC101.33 v72.39,58.72 | v72.39,15.86 89.22,15.86 91.44,13.63 JP204.3
SCK  (via drill 0.5)
  Top 0.406: v36.51,58.72 v36.51,26.33 | IC103.6 66.36,7.28 65.09,8.55 53.02,8.55 SV101.3 50.48,8.55 47.62,8.55 46.99,9.19 v44.45,9.19
  Bottom 0.406: IC101.8 v36.51,58.72 | v36.51,26.33 36.51,25.38 36.83,25.06 36.83,20.62 35.56,19.35 IC104.13 35.56,15.54 36.83,14.27 36.83,11.09 38.73,9.19 v44.45,9.19
SPG
  Bottom 0.813: IC101.40 53.34,76.5 54.29,77.45 R106.2 R107.1
V-NETZTEIL1
  Bottom 1.27: CON101.1 18.73,90.47 21.59,93.33 D103.A
VDD  (via drill 0.5)
  Top 0.813: JP204.2 96.2,16.17 96.52,16.49 96.52,38.71 | 96.52,71.1 96.52,83.17 95.89,83.8 JP201.2 | 96.52,71.1 96.52,61.26 | 96.52,61.26 JP202.2 | 96.52,38.71 JP203.2 | 96.52,61.26 96.52,38.71 | 96.52,71.1 v91.44,71.1 v87.63,71.1 | v72.07,71.1 v70.8,71.1 v69.53,71.1 v68.26,71.1 68.26,50.14 67.94,50.14 66.67,48.88 V201.OUT C202.1 66.67,28.55 C201.+
  Top 1.016: R201.2 R202.2 R203.2 | R204.2 R203.2 | R203.2 v69.53,71.1
  Bottom 0.813: v68.26,71.1 v69.53,71.1 v70.8,71.1 v72.07,71.1 v87.63,71.1 v88.9,71.1 v90.17,71.1 v91.44,71.1

### Text on the board
Bottom: MBCAN-Projekt | (c) Dr.-Ing. Th. Wiesner | 06.01.2024 | mbc84.brd | bottom
tNames: HW: 24.01.06 | +18V | DC | Status | (c) Dr.-Ing. Th. Wiesner | MBCAN-Projekt | IN | OUT | mbc-84